# Altium schematic sheet Biodigestor.SchDoc
size A4; SheetNumber: 1; SheetTotal: 1
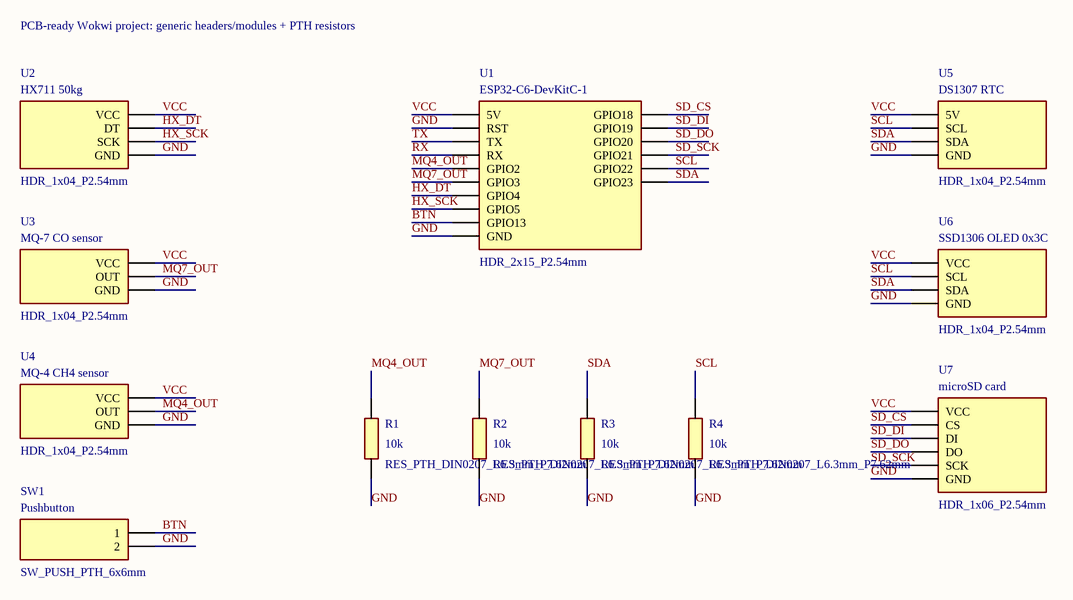
[diagram p0: Biodigestor.SchDoc]

## Parts
R1  10k  Footprint: RES_PTH_DIN0207_L6.3mm_P7.62mm
R2  10k  Footprint: RES_PTH_DIN0207_L6.3mm_P7.62mm
R3  10k  Footprint: RES_PTH_DIN0207_L6.3mm_P7.62mm
R4  10k  Footprint: RES_PTH_DIN0207_L6.3mm_P7.62mm
SW1  Pushbutton  Footprint: SW_PUSH_PTH_6x6mm
U1  ESP32-C6-DevKitC-1  Footprint: HDR_2x15_P2.54mm
U2  HX711 50kg  Footprint: HDR_1x04_P2.54mm
U3  MQ-7 CO sensor  Footprint: HDR_1x04_P2.54mm
U4  MQ-4 CH4 sensor  Footprint: HDR_1x04_P2.54mm
U5  DS1307 RTC  Footprint: HDR_1x04_P2.54mm
U6  SSD1306 OLED 0x3C  Footprint: HDR_1x04_P2.54mm
U7  microSD card  Footprint: HDR_1x06_P2.54mm

## Nets
BTN: SW1.1 U1.9(GPIO13)
GND: R1.2 R2.2 R3.2 R4.2 SW1.2 U1.2(RST) U1.10(GND) U2.4(GND) U3.3(GND) U4.3(GND) U5.4(GND) U6.4(GND) U7.6(GND)
HX_DT: U1.7(GPIO4) U2.2(DT)
HX_SCK: U1.8(GPIO5) U2.3(SCK)
MQ4_OUT: R1.1 U1.5(GPIO2) U4.2(OUT)
MQ7_OUT: R2.1 U1.6(GPIO3) U3.2(OUT)
RX: U1.4(RX)
SCL: R4.1 U1.15(GPIO22) U5.2(SCL) U6.2(SCL)
SD_CS: U1.11(GPIO18) U7.2(CS)
SD_DI: U1.12(GPIO19) U7.3(DI)
SD_DO: U1.13(GPIO20) U7.4(DO)
SD_SCK: U1.14(GPIO21) U7.5(SCK)
SDA: R3.1 U1.16(GPIO23) U5.3(SDA) U6.3(SDA)
TX: U1.3(TX)
VCC: U1.1(5V) U2.1(VCC) U3.1(VCC) U4.1(VCC) U5.1(5V) U6.1(VCC) U7.1(VCC)

## Notes on the sheet
- PCB-ready Wokwi project: generic headers/modules + PTH resistors

## Library data of the parts
R1-R4 = *: Resistor; PCB Footprint: RES_PTH_DIN0207_L6.3mm_P7.62mm; Value: 10k
SW1 U1-U7 = *
  SW1: PCB Footprint: SW_PUSH_PTH_6x6mm; Value: Pushbutton
  U1: PCB Footprint: HDR_2x15_P2.54mm; Value: ESP32-C6-DevKitC-1
  U2: PCB Footprint: HDR_1x04_P2.54mm; Value: HX711 50kg
  U3: PCB Footprint: HDR_1x04_P2.54mm; Value: MQ-7 CO sensor
  U4: PCB Footprint: HDR_1x04_P2.54mm; Value: MQ-4 CH4 sensor
  U5: PCB Footprint: HDR_1x04_P2.54mm; Value: DS1307 RTC
  U6: PCB Footprint: HDR_1x04_P2.54mm; Value: SSD1306 OLED 0x3C
  U7: PCB Footprint: HDR_1x06_P2.54mm; Value: microSD card